# Altium schematic sheet Main.SchDoc
size 152 x 152 mm; SheetNumber: 1; SheetTotal: 5
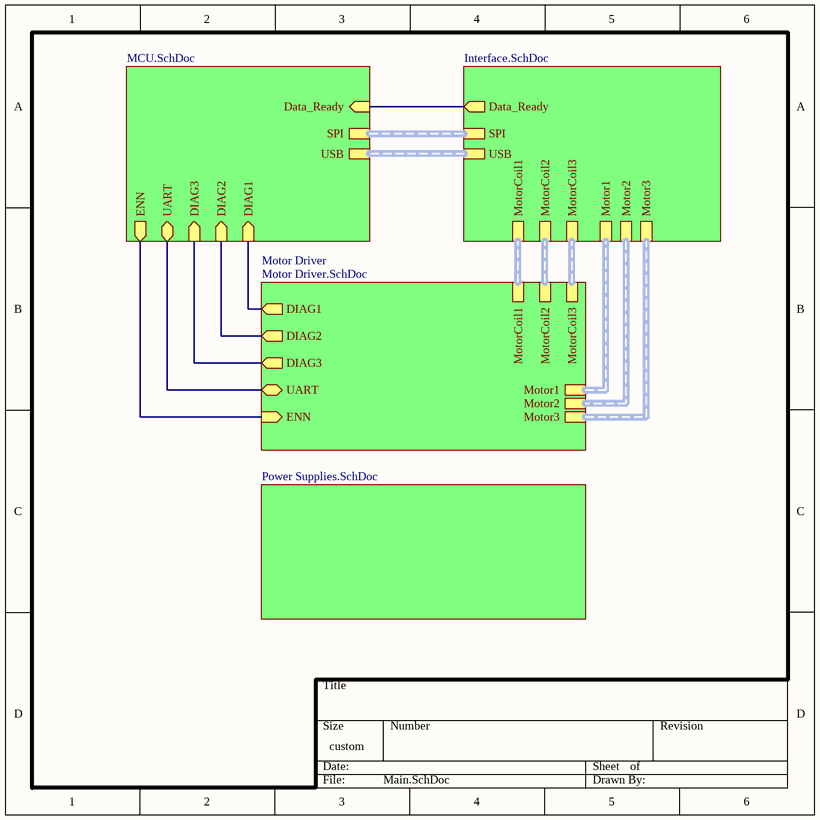
[diagram p0: Main.SchDoc]

## Sub-sheets
Interface = Interface.SchDoc: SPI (harness SPI), Data_Ready (out), MotorCoil3 (harness Motor3), MotorCoil2 (harness Motor2), MotorCoil1 (harness Motor1), Motor1 (harness Motor1), Motor2 (harness Motor2), Motor3 (harness Motor3), USB (harness USB)
MCU = MCU.SchDoc: SPI (harness SPI), Data_Ready (in), DIAG1 (in), DIAG2 (in), DIAG3 (in), UART (bidir), ENN (out), USB (harness USB)
Motor Driver = Motor Driver.SchDoc: MotorCoil3 (harness Motor3), MotorCoil2 (harness Motor2), MotorCoil1 (harness Motor1), Motor1 (harness Motor1), Motor2 (harness Motor2), Motor3 (harness Motor3), DIAG1 (out), DIAG2 (out), DIAG3 (out), UART (bidir), ENN (in)
Power Supplies = Power Supplies.SchDoc: no entries

## Nets
(unnamed): sheet MCU/Data_Ready, sheet Interface/Data_Ready
(unnamed): sheet MCU/DIAG1, sheet Motor Driver/DIAG1
(unnamed): sheet MCU/DIAG2, sheet Motor Driver/DIAG2
(unnamed): sheet MCU/DIAG3, sheet Motor Driver/DIAG3
(unnamed): sheet MCU/UART, sheet Motor Driver/UART
(unnamed): sheet MCU/ENN, sheet Motor Driver/ENN

## Buses and harness runs
harness sheet Interface/Motor1 = sheet Motor Driver/Motor1
harness sheet Interface/Motor2 = sheet Motor Driver/Motor2
harness sheet Interface/Motor3 = sheet Motor Driver/Motor3
harness sheet Interface/MotorCoil1 = sheet Motor Driver/MotorCoil1
harness sheet Interface/MotorCoil2 = sheet Motor Driver/MotorCoil2
harness sheet Interface/MotorCoil3 = sheet Motor Driver/MotorCoil3
harness sheet Interface/SPI = sheet MCU/SPI
harness sheet Interface/USB = sheet MCU/USB